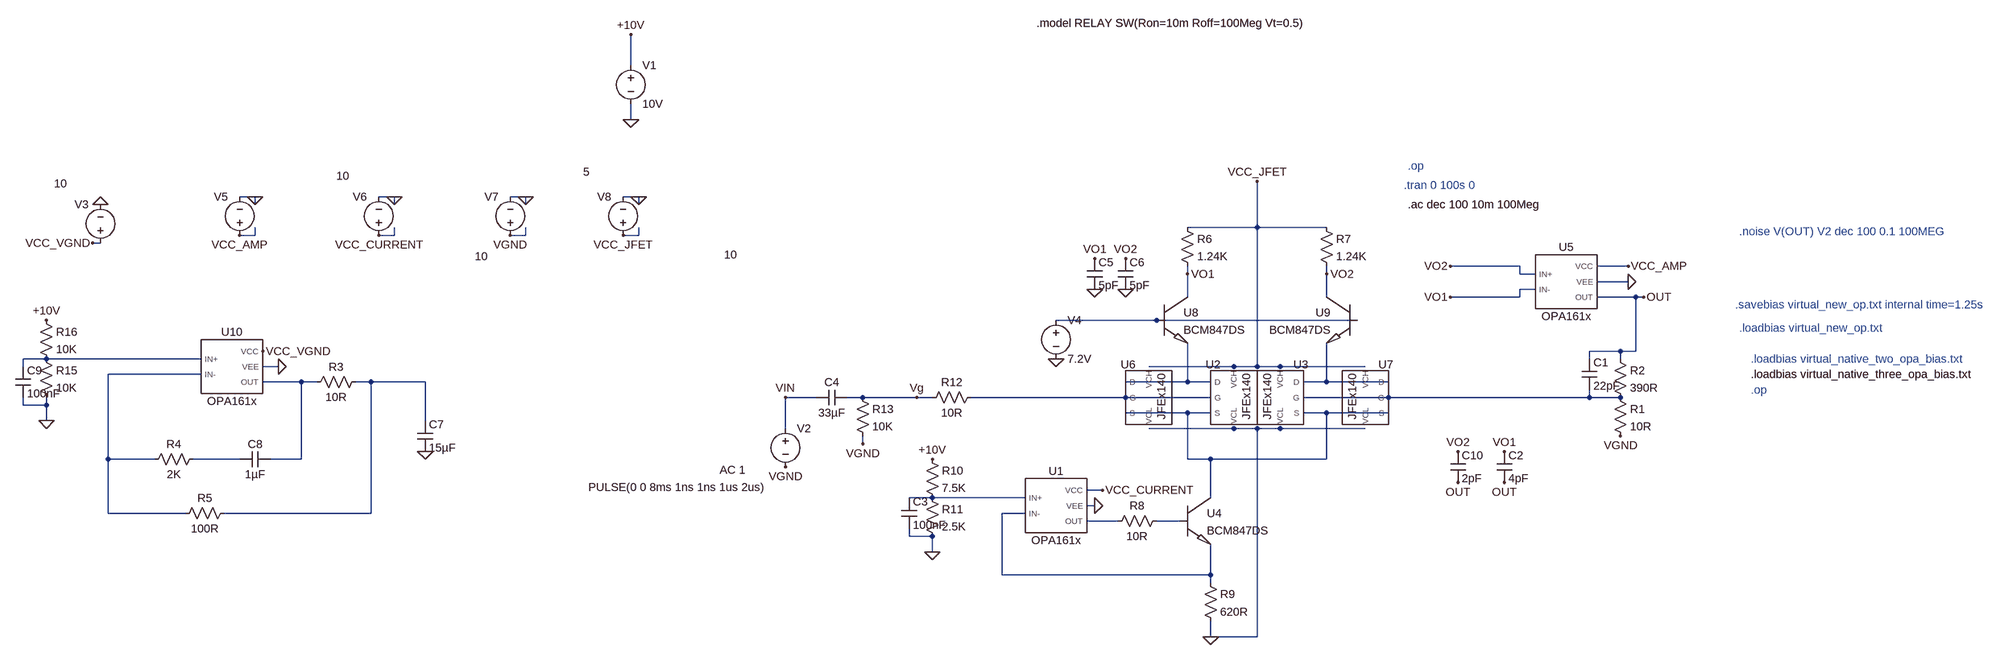
[diagram p0: schematic Vitual_GND_fixed_cascode_AC.asc]
Vitual_GND_fixed_cascode_AC.asc, the LTspice schematic file:
Version 4.1
SHEET 1 1684 1456
WIRE -1888 -272 -1888 -336
WIRE -1888 -160 -1888 -192
WIRE -2704 0 -2736 0
WIRE -2416 0 -2448 0
WIRE -2144 0 -2176 0
WIRE -1872 0 -1904 0
WIRE -2704 16 -2704 0
WIRE -2416 16 -2416 0
WIRE -2144 16 -2144 0
WIRE -1872 16 -1872 0
WIRE -592 64 -592 -32
WIRE -592 64 -736 64
WIRE -448 64 -592 64
WIRE -2704 80 -2704 64
WIRE -2704 80 -2736 80
WIRE -2416 80 -2416 64
WIRE -2416 80 -2448 80
WIRE -2144 80 -2144 64
WIRE -2144 80 -2176 80
WIRE -1872 80 -1872 64
WIRE -1872 80 -1904 80
WIRE -3024 96 -3040 96
WIRE -48 144 -192 144
WIRE 176 144 112 144
WIRE -736 160 -736 144
WIRE -448 160 -448 144
WIRE -48 160 -48 144
WIRE -16 160 -48 160
WIRE 176 176 112 176
WIRE -16 192 -48 192
WIRE -736 208 -736 160
WIRE -448 208 -448 160
WIRE -48 208 -48 192
WIRE -48 208 -192 208
WIRE 192 208 112 208
WIRE 208 208 192 208
WIRE -800 256 -1008 256
WIRE -384 256 -800 256
WIRE 160 320 96 320
WIRE 192 320 192 208
WIRE 192 320 160 320
WIRE -3136 336 -3184 336
WIRE -2816 336 -3136 336
WIRE 96 336 96 320
WIRE 160 336 160 320
WIRE -3184 352 -3184 336
WIRE -2656 352 -2688 352
WIRE -640 352 -816 352
WIRE -592 352 -592 64
WIRE -592 352 -640 352
WIRE -544 352 -592 352
WIRE -368 352 -544 352
WIRE -2816 368 -3008 368
WIRE -2608 384 -2688 384
WIRE -2576 384 -2608 384
WIRE -2464 384 -2496 384
WIRE -2352 384 -2464 384
WIRE -736 384 -736 304
WIRE -736 384 -864 384
WIRE -688 384 -736 384
WIRE -448 384 -448 304
WIRE -448 384 -496 384
WIRE -320 384 -448 384
WIRE -1504 416 -1568 416
WIRE -1408 416 -1440 416
WIRE -1296 416 -1408 416
WIRE -1264 416 -1296 416
WIRE -864 416 -1184 416
WIRE -688 416 -864 416
WIRE -320 416 -496 416
WIRE 96 416 96 400
WIRE 96 416 -320 416
WIRE 160 416 96 416
WIRE -3184 432 -3184 416
WIRE -3136 432 -3136 416
WIRE -3136 432 -3184 432
WIRE -736 448 -864 448
WIRE -688 448 -736 448
WIRE -448 448 -496 448
WIRE -320 448 -448 448
WIRE -3136 464 -3136 432
WIRE -2352 464 -2352 384
WIRE -1568 480 -1568 416
WIRE -640 480 -816 480
WIRE -592 480 -640 480
WIRE -544 480 -592 480
WIRE -368 480 -544 480
WIRE -1408 512 -1408 496
WIRE -3008 544 -3008 368
WIRE -2912 544 -3008 544
WIRE -2736 544 -2832 544
WIRE -2608 544 -2608 384
WIRE -2608 544 -2672 544
WIRE -736 544 -736 448
WIRE -688 544 -736 544
WIRE -448 544 -448 448
WIRE -448 544 -688 544
WIRE -912 608 -944 608
WIRE -1264 624 -1312 624
WIRE -1072 624 -1264 624
WIRE -688 624 -688 544
WIRE -928 640 -944 640
WIRE -3008 656 -3008 544
WIRE -2848 656 -3008 656
WIRE -2464 656 -2464 384
WIRE -2464 656 -2768 656
WIRE -1072 656 -1120 656
WIRE -880 672 -944 672
WIRE -752 672 -800 672
WIRE -1312 704 -1312 688
WIRE -1264 704 -1312 704
WIRE -1264 736 -1264 704
WIRE -1120 784 -1120 656
WIRE -688 784 -688 720
WIRE -688 784 -1120 784
WIRE -688 800 -688 784
WIRE -688 912 -688 880
WIRE -592 912 -592 480
WIRE -592 912 -688 912
FLAG -1888 -160 0
FLAG -1888 -336 +10V
FLAG -688 912 0
FLAG -1264 736 0
FLAG -1264 544 +10V
FLAG -928 640 0
FLAG -736 160 VO1
FLAG -448 160 VO2
FLAG -1408 512 VGND
FLAG -1296 416 Vg
FLAG -1568 416 VIN
FLAG -928 128 VO1
FLAG -928 192 0
FLAG -864 128 VO2
FLAG -864 192 0
FLAG -1008 336 0
FLAG -192 208 VO1
FLAG -192 144 VO2
FLAG -80 528 VO1
FLAG 208 208 OUT
FLAG -80 592 OUT
FLAG 176 176 0
FLAG 160 496 VGND
FLAG 176 144 VCC_AMP
FLAG -2736 80 VCC_AMP
FLAG -2448 80 VCC_CURRENT
FLAG -1904 80 VCC_JFET
FLAG -2176 80 VGND
FLAG -592 -32 VCC_JFET
FLAG -912 608 VCC_CURRENT
FLAG -2704 0 0
FLAG -2416 0 0
FLAG -2144 0 0
FLAG -1872 0 0
FLAG -1568 560 VGND
FLAG -2352 528 0
FLAG -3040 96 VCC_VGND
FLAG -3024 16 0
FLAG -2688 320 VCC_VGND
FLAG -2656 352 0
FLAG -3136 464 0
FLAG -3136 256 +10V
FLAG -176 592 OUT
FLAG -176 528 VO2
SYMBOL voltage -1888 -288 R0
WINDOW 123 0 0 Left 0
WINDOW 39 0 0 Left 0
SYMATTR InstName V1
SYMATTR Value 10V
SYMBOL JFEx140 -640 416 R0
SYMATTR InstName U2
SYMBOL JFEx140 -544 416 M0
SYMATTR InstName U3
SYMBOL res -752 48 R0
SYMATTR InstName R6
SYMATTR Value 1.24K
SYMBOL res -464 48 R0
SYMATTR InstName R7
SYMATTR Value 1.24K
SYMBOL BCM847DS -752 624 R0
SYMATTR InstName U4
SYMBOL res -784 656 R90
WINDOW 0 0 56 VBottom 2
WINDOW 3 32 56 VTop 2
SYMATTR InstName R8
SYMATTR Value 10R
SYMBOL res -704 784 R0
SYMATTR InstName R9
SYMATTR Value 620R
SYMBOL res -1280 528 R0
SYMATTR InstName R10
SYMATTR Value 7.5K
SYMBOL res -1280 608 R0
SYMATTR InstName R11
SYMATTR Value 2.5K
SYMBOL cap -1328 624 R0
SYMATTR InstName C3
SYMATTR Value 100nF
SYMBOL JFEx140 -816 416 R0
SYMATTR InstName U6
SYMBOL JFEx140 -368 416 M0
SYMATTR InstName U7
SYMBOL res -1168 400 R90
WINDOW 0 0 56 VBottom 2
WINDOW 3 32 56 VTop 2
SYMATTR InstName R12
SYMATTR Value 10R
SYMBOL voltage -1568 464 R0
WINDOW 3 -408 138 Left 2
WINDOW 123 -136 102 Left 2
WINDOW 39 0 0 Left 0
SYMATTR Value PULSE(0 0 8ms 1ns 1ns 1us 2us)
SYMATTR Value2 AC 1
SYMATTR InstName V2
SYMBOL cap -1440 400 R90
WINDOW 0 0 32 VBottom 2
WINDOW 3 32 32 VTop 2
SYMATTR InstName C4
SYMATTR Value 33µF
SYMBOL res -1424 400 R0
SYMATTR InstName R13
SYMATTR Value 10K
SYMBOL cap -944 128 R0
SYMATTR InstName C5
SYMATTR Value 5pF
SYMBOL cap -880 128 R0
SYMATTR InstName C6
SYMATTR Value 5pF
SYMBOL BCM847DS -800 208 R0
SYMATTR InstName U8
SYMBOL BCM847DS -384 208 M0
SYMATTR InstName U9
SYMBOL voltage -1008 240 R0
WINDOW 123 0 0 Left 0
WINDOW 39 0 0 Left 0
SYMATTR InstName V4
SYMATTR Value 7.2V
SYMBOL OPA161x 48 176 R0
SYMATTR InstName U5
SYMBOL cap -96 528 R0
SYMATTR InstName C2
SYMATTR Value 4pF
SYMBOL res 144 400 R0
SYMATTR InstName R1
SYMATTR Value 10R
SYMBOL res 144 320 R0
SYMATTR InstName R2
SYMATTR Value 390R
SYMBOL cap 80 336 R0
SYMATTR InstName C1
SYMATTR Value 22pF
SYMBOL OPA161x -1008 640 R0
SYMATTR InstName U1
SYMBOL voltage -2736 96 R180
WINDOW 0 24 96 Left 2
WINDOW 3 -227 139 Left 2
WINDOW 123 0 0 Left 0
WINDOW 39 0 0 Left 0
SYMATTR InstName V5
SYMATTR Value 10
SYMBOL voltage -2448 96 R180
WINDOW 0 24 96 Left 2
WINDOW 3 -226 -28 Left 2
WINDOW 123 0 0 Left 0
WINDOW 39 0 0 Left 0
SYMATTR InstName V6
SYMATTR Value 10
SYMBOL voltage -2176 96 R180
WINDOW 0 24 96 Left 2
WINDOW 3 -203 147 Left 2
WINDOW 123 0 0 Left 0
WINDOW 39 0 0 Left 0
SYMATTR InstName V7
SYMATTR Value 5
SYMBOL voltage -1904 96 R180
WINDOW 0 24 96 Left 2
WINDOW 3 -236 -24 Left 2
WINDOW 123 0 0 Left 0
WINDOW 39 0 0 Left 0
SYMATTR InstName V8
SYMATTR Value 10
SYMBOL OPA161x -2752 352 R0
SYMATTR InstName U10
SYMBOL res -2480 368 R90
WINDOW 0 0 56 VBottom 2
WINDOW 3 32 56 VTop 2
SYMATTR InstName R3
SYMATTR Value 10R
SYMBOL cap -2368 464 R0
SYMATTR InstName C7
SYMATTR Value 15µF
SYMATTR SpiceLine Rser=10mR Lser=1nH
SYMBOL cap -2672 528 R90
WINDOW 0 0 32 VBottom 2
WINDOW 3 32 32 VTop 2
SYMATTR InstName C8
SYMATTR Value 1µF
SYMBOL res -2816 528 R90
WINDOW 0 0 56 VBottom 2
WINDOW 3 32 56 VTop 2
SYMATTR InstName R4
SYMATTR Value 2K
SYMBOL res -2752 640 R90
WINDOW 0 0 56 VBottom 2
WINDOW 3 32 56 VTop 2
SYMATTR InstName R5
SYMATTR Value 100R
SYMBOL voltage -3024 112 R180
WINDOW 0 24 96 Left 2
WINDOW 3 69 139 Left 2
WINDOW 123 0 0 Left 0
WINDOW 39 0 0 Left 0
SYMATTR InstName V3
SYMATTR Value 10
SYMBOL res -3152 320 R0
SYMATTR InstName R15
SYMATTR Value 10K
SYMBOL res -3152 240 R0
SYMATTR InstName R16
SYMATTR Value 10K
SYMBOL cap -3200 352 R0
SYMATTR InstName C9
SYMATTR Value 100nF
SYMBOL cap -192 528 R0
SYMATTR InstName C10
SYMATTR Value 2pF
TEXT -280 16 Left 2 !.ac dec 100 10m 100Meg
TEXT -288 -24 Left 2 ;.tran 0 100s 0
TEXT -280 -64 Left 2 ;.op
TEXT 416 224 Left 2 ;.savebias virtual_new_op.txt internal time=1.25s
TEXT 424 272 Left 2 ;.loadbias virtual_new_op.txt
TEXT 448 400 Left 2 ;.op
TEXT 448 336 Left 2 ;.loadbias virtual_native_two_opa_bias.txt
TEXT -1048 -360 Left 2 !.model RELAY SW(Ron=10m Roff=100Meg Vt=0.5)
TEXT 424 72 Left 2 ;.noise V(OUT) V2 dec 100 0.1 100MEG
TEXT 448 368 Left 2 !.loadbias virtual_native_three_opa_bias.txt

The netlist it stands for:
* Vitual_GND_fixed_cascode_AC.asc
V1 +10V 0 10V
X§U2 N006 N008 N010 VCC_JFET 0 JFEx140  ; pins D G S VCH VCL
X§U3 N007 N009 N010 VCC_JFET 0 JFEx140  ; pins D G S VCH VCL
R6 VCC_JFET VO1 1.24K
R7 VCC_JFET VO2 1.24K
X§U4 N010 N015 N013 BCM847DS  ; pins C B E
R8 N015 N014 10R
R9 N013 0 620R
R10 +10V N012 7.5K
R11 N012 0 2.5K
C3 N012 0 100nF
X§U6 N006 N008 N010 VCC_JFET 0 JFEx140  ; pins D G S VCH VCL
X§U7 N007 N009 N010 VCC_JFET 0 JFEx140  ; pins D G S VCH VCL
R12 N008 Vg 10R
V2 VIN VGND PULSE(0 0 8ms 1ns 1ns 1us 2us) AC 1
C4 Vg VIN 33µF
R13 Vg VGND 10K
C5 VO1 0 5pF
C6 VO2 0 5pF
X§U8 VO1 N001 N006 BCM847DS  ; pins C B E
X§U9 VO2 N001 N007 BCM847DS  ; pins C B E
V4 N001 0 7.2V
X§U5 VO2 VO1 VCC_AMP 0 OUT OPA161x  ; pins IN+ IN- VCC VEE OUT
C2 VO1 OUT 4pF
R1 N009 VGND 10R
R2 OUT N009 390R
C1 OUT N009 22pF
X§U1 N012 N013 VCC_CURRENT 0 N014 OPA161x  ; pins IN+ IN- VCC VEE OUT
V5 VCC_AMP 0 10
V6 VCC_CURRENT 0 10
V7 VGND 0 5
V8 VCC_JFET 0 10
X§U10 N002 N003 VCC_VGND 0 N004 OPA161x  ; pins IN+ IN- VCC VEE OUT
R3 N005 N004 10R
C7 N005 0 15µF Rser=10mR Lser=1nH
C8 N004 N011 1µF
R4 N011 N003 2K
R5 N005 N003 100R
V3 VCC_VGND 0 10
R15 N002 0 10K
R16 +10V N002 10K
C9 N002 0 100nF
C10 VO2 OUT 2pF
.ac dec 100 10m 100Meg
* .tran 0 100s 0
* .op
* .savebias virtual_new_op.txt internal time=1.25s
* .loadbias virtual_new_op.txt
* .op
* .loadbias virtual_native_two_opa_bias.txt
.model RELAY SW(Ron=10m Roff=100Meg Vt=0.5)
* .noise V(OUT) V2 dec 100 0.1 100MEG
.loadbias virtual_native_three_opa_bias.txt
.lib jfex140.lib
.lib BCM847.lib
.lib OPA161x.LIB
.backanno
.end